# Altium schematic sheet Sheet1_draft.SchDoc
size A; SheetNumber: 1; SheetTotal: 1
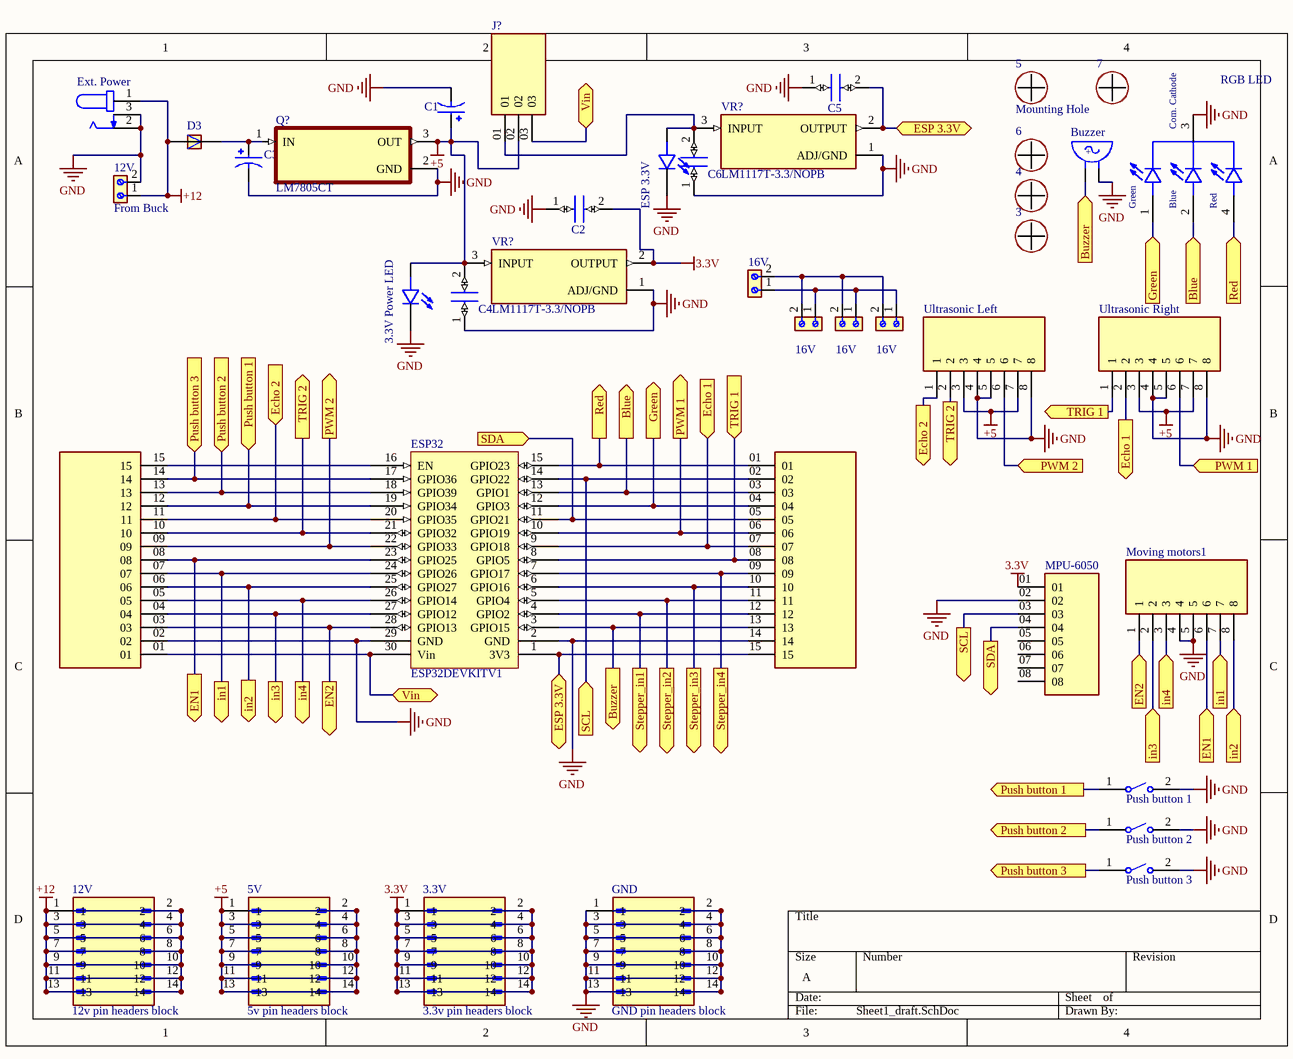
[diagram p0: Sheet1_draft.SchDoc]

## Parts
(Parts that share a designator on the sheet are numbered #1, #2 ... from top to bottom, then left to right.)
3  Mounting Hole  [PCBComponent_1]  (value not drawn)
3.3V  3.3v pin headers block  [AMPHENOL_52601-S14-4LF]
3.3V_Power_LED  LED 5mm  [LED 5mm]  (value not drawn)
4  Mounting Hole  [PCBComponent_1]  (value not drawn)
5  Mounting Hole  [PCBComponent_1]
5V  5v pin headers block  [AMPHENOL_52601-S14-4LF]
6  Mounting Hole  [PCBComponent_1]  (value not drawn)
7  Mounting Hole  [PCBComponent_1]  (value not drawn)
12V#1  From Buck  [691213510002]
12V#2  12v pin headers block  [AMPHENOL_52601-S14-4LF]
16V#1  From Buck  [691213510002]  (value not drawn)
16V#2  From Buck  [691213510002]  (value not drawn)
16V#3  From Buck  [691213510002]  (value not drawn)
16V#4  From Buck  [691213510002]  (value not drawn)
Buzzer  Buzzer  [Buzzer 5V]  (value not drawn)
C1  CAP  33UF 50V RADIAL  [CAP  33UF 50V RADIAL]  (value not drawn)
C2  Ceramic Capacitor 100nF  [C320C]  (value not drawn)
C3  CAP  33UF 50V RADIAL  [CAP  33UF 50V RADIAL]  (value not drawn)
C4  Ceramic Capacitor 100nF  [C320C]  (value not drawn)
C5  Ceramic Capacitor 100nF  [C320C]  (value not drawn)
C6  Ceramic Capacitor 100nF  [C320C]  (value not drawn)
D3  RL207  [DIOAD1300W80L670D310]  (value not drawn)
ESP32  ESP32DEVKITV1  [ESP32DEVKITV1]
ESP_3.3V  LED 5mm  [LED 5mm]  (value not drawn)
Ext._Power  DC Power Jack Female Socket  [DC Power Jack Female Socket]  (value not drawn)
GND  GND pin headers block  [AMPHENOL_52601-S14-4LF]
J5  TS-115-T-A-1  [SAMTEC_TS-115-T-A-1]  (value not drawn)
J6  TS-115-T-A-1  [SAMTEC_TS-115-T-A-1]  (value not drawn)
J?  TS-103-T-A-1  [SAMTEC_TS-103-T-A-1]  (value not drawn)
Moving_motors1  Pin header female block 8 pin  [Pin header female block 8 pin]  (value not drawn)
MPU-6050  MPU-6050  [MPU-6050]  (value not drawn)
Push_button_1  FSM8JRT  [TE_FSM8JRT]  (value not drawn)
Push_button_2  FSM8JRT  [TE_FSM8JRT]  (value not drawn)
Push_button_3  FSM8JRT  [TE_FSM8JRT]  (value not drawn)
Q?  LM7805CT  [TO254P1054X470X1955-3]
RGB_LED  common cathode  [LED RGB 5mm]  (value not drawn)
Ultrasonic_Left  Pin header female block 8 pin  [Pin header female block 8 pin]  (value not drawn)
Ultrasonic_Right  Pin header female block 8 pin  [Pin header female block 8 pin]  (value not drawn)
VR?#1  LM1117T-3.3/NOPB  [TO254P1054X470X1955-3]
VR?#2  LM1117T-3.3/NOPB  [TO254P1054X470X1955-3]

## Ports
Blue (in, see Sheet1[2B]), Blue (out, see Sheet1[4B]), Buzzer (in, see Sheet1[2C]), Buzzer (out, see Sheet1[4A]), Echo 1 (in, see Sheet1[4B]), Echo 1 (out, see Sheet1[3B]), Echo 2 (in, see Sheet1[3B]), Echo 2 (out, see Sheet1[1B]), EN1 (in, see Sheet1[1C]), EN1 (out, see Sheet1[4C]), EN2 (in, see Sheet1[2C]), EN2 (out, see Sheet1[4C]), ESP 3.3V (bidir, see Sheet1[2C]), ESP 3.3V (bidir, see Sheet1[3A]), Green (in, see Sheet1[3B]), Green (out, see Sheet1[4B]), in1 (in, see Sheet1[1C]), in1 (out, see Sheet1[4C]), in2 (in, see Sheet1[1C]), in2 (out, see Sheet1[4C]), in3 (in, see Sheet1[1C]), in3 (out, see Sheet1[4C]), in4 (in, see Sheet1[1C]), in4 (out, see Sheet1[4C]), Push button 1 (in, see Sheet1[4C]), Push button 1 (out, see Sheet1[1B]), Push button 2 (in, see Sheet1[4D]), Push button 2 (out, see Sheet1[1B]), Push button 3 (in, see Sheet1[4D]), Push button 3 (out, see Sheet1[1B]), PWM 1 (in, see Sheet1[3B]), PWM 1 (out, see Sheet1[4B]), PWM 2 (in, see Sheet1[2B]), PWM 2 (out, see Sheet1[4B]), Red (in, see Sheet1[2B]), Red (out, see Sheet1[4B]), SCL (in, see Sheet1[3C]), SCL (out, see Sheet1[2C]), SDA (in, see Sheet1[4C]), SDA (out, see Sheet1[2B]), Stepper_in1 (out), Stepper_in2 (out), Stepper_in3 (out), Stepper_in4 (out), TRIG 1 (in, see Sheet1[4B]), TRIG 1 (out, see Sheet1[3B]), TRIG 2 (out, see Sheet1[1B]), TRIG 2 (out, see Sheet1[3B]), Vin (bidir, see Sheet1[2A]), Vin (bidir, see Sheet1[2C])

## Nets
3.3V: 3.3V.1 3.3V.2 3.3V.3 3.3V.4 3.3V.5 3.3V.6 3.3V.7 3.3V.8 3.3V.9 3.3V.10 3.3V.11 3.3V.12 3.3V.13 3.3V.14 C2.2 MPU-6050.01 VR?#2.2(OUTPUT)
+5: 3.3V_Power_LED.A 5V.1 5V.2 5V.3 5V.4 5V.5 5V.6 5V.7 5V.8 5V.9 5V.10 5V.11 5V.12 5V.13 5V.14 C1.P C4.2 J?.02 Q?.3(OUT) Ultrasonic_Left.3 Ultrasonic_Left.7 Ultrasonic_Right.3 Ultrasonic_Right.7 VR?#2.3(INPUT)
+12: 12V#1.1 12V#2.1 12V#2.2 12V#2.3 12V#2.4 12V#2.5 12V#2.6 12V#2.7 12V#2.8 12V#2.9 12V#2.10 12V#2.11 12V#2.12 12V#2.13 12V#2.14 D3.A Ext._Power.1
GND: 3.3V_Power_LED.C 12V#1.2 Buzzer.NEG C1.N C2.1 C3.N C4.1 C5.1 C6.1 ESP32.2(GND) ESP32.29(GND) ESP_3.3V.C Ext._Power.2 Ext._Power.3 GND.1 GND.2 GND.3 GND.4 GND.5 GND.6 GND.7 GND.8 GND.9 GND.10 GND.11 GND.12 GND.13 GND.14 J5.14 J6.02 Moving_motors1.4 Moving_motors1.5 MPU-6050.02 Push_button_1.2 Push_button_2.2 Push_button_3.2 Q?.2(GND) RGB_LED.3(Com._Cathode) Ultrasonic_Left.4 Ultrasonic_Left.5 Ultrasonic_Left.8 Ultrasonic_Right.4 Ultrasonic_Right.5 Ultrasonic_Right.8 VR?#1.1(ADJ/GND) VR?#2.1(ADJ/GND)
Blue: ESP32.13(GPIO1) J5.03 RGB_LED.2(BLUE) ; port Blue
Buzzer: Buzzer.POS ESP32.3(GPIO15) J5.13 ; port Buzzer
Echo 1: ESP32.9(GPIO18) J5.07 Ultrasonic_Right.2 ; port Echo 1
Echo 2: ESP32.20(GPIO35) J6.11 Ultrasonic_Left.1 ; port Echo 2
EN1: ESP32.23(GPIO25) J6.08 Moving_motors1.6 ; port EN1
EN2: ESP32.28(GPIO13) J6.03 Moving_motors1.1 ; port EN2
ESP 3.3V: C5.2 ESP32.1(3V3) J5.15 VR?#1.2(OUTPUT) ; port ESP 3.3V
Green: ESP32.12(GPIO3) J5.04 RGB_LED.1(Green) ; port Green
in1: ESP32.24(GPIO26) J6.07 Moving_motors1.7 ; port in1
in2: ESP32.25(GPIO27) J6.06 Moving_motors1.8 ; port in2
in3: ESP32.27(GPIO12) J6.04 Moving_motors1.2 ; port in3
in4: ESP32.26(GPIO14) J6.05 Moving_motors1.3 ; port in4
Push button 1: ESP32.19(GPIO34) J6.12 Push_button_1.1 ; port Push button 1
Push button 2: ESP32.18(GPIO39) J6.13 Push_button_2.1 ; port Push button 2
Push button 3: ESP32.17(GPIO36) J6.14 Push_button_3.1 ; port Push button 3
PWM 1: ESP32.10(GPIO19) J5.06 Ultrasonic_Right.6 ; port PWM 1
PWM 2: ESP32.22(GPIO33) J6.09 Ultrasonic_Left.6 ; port PWM 2
Red: ESP32.15(GPIO23) J5.01 RGB_LED.4(Red) ; port Red
SCL: ESP32.14(GPIO22) J5.02 MPU-6050.03 ; port SCL
SDA: ESP32.11(GPIO21) J5.05 MPU-6050.04 ; port SDA
Stepper_in1: ESP32.4(GPIO2) J5.12 ; port Stepper_in1
Stepper_in2: ESP32.5(GPIO4) J5.11 ; port Stepper_in2
Stepper_in3: ESP32.6(GPIO16) J5.10 ; port Stepper_in3
Stepper_in4: ESP32.7(GPIO17) J5.09 ; port Stepper_in4
TRIG 1: ESP32.8(GPIO5) J5.08 Ultrasonic_Right.1 ; port TRIG 1
TRIG 2: ESP32.21(GPIO32) J6.10 Ultrasonic_Left.2 ; port TRIG 2
Vin: ESP32.30(Vin) J6.01 J?.03 ; port Vin
Net16V#1_1: 16V#1.1 16V#2.1 16V#3.1 16V#4.1
Net16V#1_2: 16V#1.2 16V#2.2 16V#3.2 16V#4.2
NetC3_P: C3.P D3.C Q?.1(IN)
NetC6_2: C6.2 ESP_3.3V.A J?.01 VR?#1.3(INPUT)
NetESP32_16: ESP32.16(EN) J6.15

Not connected (* = marked no-connect by the designer): MPU-6050 05 06 07 08

## Notes on the sheet
- (in symbol Buzzer 5V) +; -
- (in symbol LED RGB 5mm) Blue

## Library data of the parts
3.3V 5V 12V#2 GND = 52601-S14-4LF: MF: {'manufacturer': u'Amphenol ICC (FCI)'}; Package: None; Price: None; Value: *; MP: 52601-S14-4LF; Availability: Unavailable
3.3V_Power_LED ESP_3.3V = LED 5mm: Red 623nm LED Indication - Discrete 1.9V Radial; MF: {'manufacturer': u'Wurth Elektronik'}; MP: 151054RS03000; Package: None; Price: None; Value: *; Availability: Unavailable
12V#1 16V#1-16V#4 = Terminal Block: 2 Position Wire to Board Terminal Block Horizontal with Board 0.200 (5.08mm) Through Hole; MF: Wurth Electronics; SnapEDA_Link: https://www.snapeda.com/parts/691213510002/Wurth+Electronics/view-part/?ref=snap; Package: None; Value: *; MP: 691213510002; Check_prices: https://www.snapeda.com/parts/691213510002/Wurth+Electronics/view-part/?ref=eda
Buzzer = Buzzer 5V: BUZZER 2.3KHZ 4-6VDC; MF: {'manufacturer': u'Soberton Inc.'}; MP: WST-1205S; Package: None; Price: None; Value: *; Availability: Unavailable
C1 C3 = CAP  33UF 50V RADIAL: NHG-A; MF: {'manufacturer': u'Panasonic'}; MP: ECA1HHG330I; Package: None; Price: None; Value: *; Availability: Unavailable
C2 C4-C6 = Ceramic Capacitor 100nF: 0.1ÂµF Â±20% 50V Ceramic Capacitor Z5U Radial; MF: KEMET; MP: C320C104M5U5TA; Package: Radial KEMET; Value: *; SnapEDA_Link: https://www.snapeda.com/parts/C320C104M5U5TA/KEMET/view-part/228184/?ref=snap; Price: None; Availability: Unavailable
D3 = RL207: Semiconductors and Actives, Power Diodes, Discretes (diodes, transistors, thyristors ...), Diodes; MF: {'manufacturer': u'Diodes Inc.'}; Package: None; Price: None; Value: *; MP: RL207; Availability: Unavailable
Ext._Power = DC Power Jack Female Socket: 2.0 mm Center Pin, 2.5 A, Right Angle, Through Hole, Dc Power Jack Connector; MF: {'manufacturer': u'CUI Devices'}; MP: PJ-002A; Package: None; Price: None; Value: *; Availability: Unavailable
J5 J6 = TS-115-T-A-1: MF: {'manufacturer': u'Samtec'}; Package: None; Price: None; Value: *; MP: TS-115-T-A-1; Availability: Unavailable
J? = TS-103-T-A-1: MF: {'manufacturer': u'Samtec'}; Package: None; Price: None; Value: *; MP: TS-103-T-A-1; Availability: Unavailable
Moving_motors1 Ultrasonic_Left Ultrasonic_Right = Pin header female block 8 pin: MF: {'manufacturer': u'TE Connectivity'}; MP: 5-534998-4; Package: None; Price: None; Value: *; Availability: Unavailable
Push_button_1-Push_button_3 = FSM8JRT: Tactile Switches PUSHBUTTON SWITCH TACT; MF: {'manufacturer': u'TE Connectivity'}; Package: None; Price: None; Value: *; MP: FSM8JRT; Availability: Unavailable
Q? = LM7805CT/NOPB: MF: {'manufacturer': u'Texas Instruments'}; Package: None; Price: None; Value: *; MP: LM7805CT/NOPB; Availability: Unavailable
RGB_LED = LED RGB 5mm: MF: {'manufacturer': u'Kingbright'}; MP: WP154A4SUREQBFZGC; Package: None; Price: None; Value: *; Availability: Unavailable
VR?#1 VR?#2 = LM1117T-3.3/NOPB: MF: {'manufacturer': u'Texas Instruments'}; Package: None; Price: None; Value: *; MP: LM1117T-3.3/NOPB; Availability: Unavailable